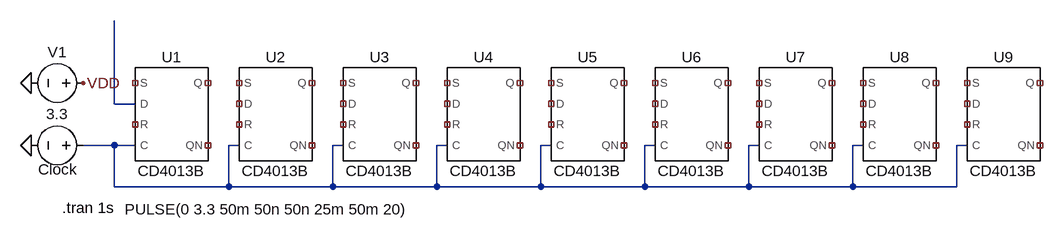
[diagram p0: schematic JohnsonCounterD.asc]
JohnsonCounterD.asc, the LTspice schematic file:
Version 4
SHEET 1 2252 712
WIRE 96 240 96 112
WIRE 128 240 96 240
WIRE 96 304 48 304
WIRE 128 304 96 304
WIRE 288 304 272 304
WIRE 448 304 432 304
WIRE 608 304 592 304
WIRE 768 304 752 304
WIRE 928 304 912 304
WIRE 1088 304 1072 304
WIRE 1248 304 1232 304
WIRE 1408 304 1392 304
WIRE 96 368 96 304
WIRE 272 368 272 304
WIRE 272 368 96 368
WIRE 432 368 432 304
WIRE 432 368 272 368
WIRE 592 368 592 304
WIRE 592 368 432 368
WIRE 752 368 752 304
WIRE 752 368 592 368
WIRE 912 368 912 304
WIRE 912 368 752 368
WIRE 1072 368 1072 304
WIRE 1072 368 912 368
WIRE 1232 368 1232 304
WIRE 1232 368 1072 368
WIRE 1392 368 1392 304
WIRE 1392 368 1232 368
FLAG -32 304 0
FLAG -32 208 0
FLAG 48 208 VDD
SYMBOL voltage 64 208 R90
WINDOW 0 -32 56 VBottom 2
WINDOW 3 32 56 VTop 2
SYMATTR InstName V1
SYMATTR Value 3.3
SYMBOL voltage 64 304 R90
WINDOW 0 53 55 VBottom 2
WINDOW 3 83 -267 VTop 2
SYMATTR InstName Clock
SYMATTR Value PULSE(0 3.3 50m 50n 50n 25m 50m 20)
SYMBOL CD4013B 176 272 R0
SYMATTR InstName U1
SYMBOL CD4013B 336 272 R0
SYMATTR InstName U2
SYMBOL CD4013B 496 272 R0
SYMATTR InstName U3
SYMBOL CD4013B 656 272 R0
SYMATTR InstName U4
SYMBOL CD4013B 816 272 R0
SYMATTR InstName U5
SYMBOL CD4013B 976 272 R0
SYMATTR InstName U6
SYMBOL CD4013B 1136 272 R0
SYMATTR InstName U7
SYMBOL CD4013B 1296 272 R0
SYMATTR InstName U8
SYMBOL CD4013B 1456 272 R0
SYMATTR InstName U9
TEXT 16 400 Left 2 !.tran 1s

The netlist it stands for:
* JohnsonCounterD.asc
V1 VDD 0 3.3
V§Clock N002 0 PULSE(0 3.3 50m 50n 50n 25m 50m 20)
XU1 NC_01 N002 N001 NC_02 NC_03 NC_04 VDD 0 CD4013B VDD=3.3 SPEED=0.1 TRIPDT=1e-9  ; pins S C D R Q QN
XU2 NC_05 N002 NC_06 NC_07 NC_08 NC_09 VDD 0 CD4013B VDD=3.3 SPEED=0.1 TRIPDT=1e-9  ; pins S C D R Q QN
XU3 NC_10 N002 NC_11 NC_12 NC_13 NC_14 VDD 0 CD4013B VDD=3.3 SPEED=0.1 TRIPDT=1e-9  ; pins S C D R Q QN
XU4 NC_15 N002 NC_16 NC_17 NC_18 NC_19 VDD 0 CD4013B VDD=3.3 SPEED=0.1 TRIPDT=1e-9  ; pins S C D R Q QN
XU5 NC_20 N002 NC_21 NC_22 NC_23 NC_24 VDD 0 CD4013B VDD=3.3 SPEED=0.1 TRIPDT=1e-9  ; pins S C D R Q QN
XU6 NC_25 N002 NC_26 NC_27 NC_28 NC_29 VDD 0 CD4013B VDD=3.3 SPEED=0.1 TRIPDT=1e-9  ; pins S C D R Q QN
XU7 NC_30 N002 NC_31 NC_32 NC_33 NC_34 VDD 0 CD4013B VDD=3.3 SPEED=0.1 TRIPDT=1e-9  ; pins S C D R Q QN
XU8 NC_35 N002 NC_36 NC_37 NC_38 NC_39 VDD 0 CD4013B VDD=3.3 SPEED=0.1 TRIPDT=1e-9  ; pins S C D R Q QN
XU9 NC_40 N002 NC_41 NC_42 NC_43 NC_44 VDD 0 CD4013B VDD=3.3 SPEED=0.1 TRIPDT=1e-9  ; pins S C D R Q QN
.tran 1s
.lib CD4000_v.lib
.backanno
.end